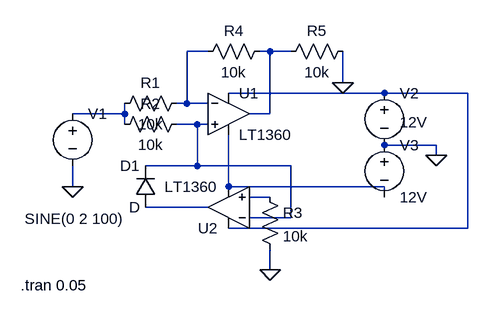
[diagram p0: schematic Functia modul.asc]
Functia modul.asc, the LTspice schematic file:
Version 4
SHEET 1 880 680
WIRE 192 16 160 16
WIRE 288 16 272 16
WIRE 320 16 288 16
WIRE 400 64 400 16
WIRE 464 80 224 80
WIRE 592 80 464 80
WIRE 160 96 160 16
WIRE 160 96 144 96
WIRE 192 96 160 96
WIRE 64 112 64 96
WIRE 64 112 -16 112
WIRE 288 112 288 16
WIRE 288 112 256 112
WIRE 64 128 64 112
WIRE 176 128 144 128
WIRE 192 128 176 128
WIRE 544 160 464 160
WIRE 544 176 544 160
WIRE 176 192 176 128
WIRE 176 192 96 192
WIRE 320 192 176 192
WIRE -16 224 -16 192
WIRE 224 224 224 144
WIRE 464 224 224 224
WIRE 288 240 256 240
WIRE 464 240 464 224
WIRE 192 256 96 256
WIRE 320 272 320 192
WIRE 320 272 256 272
WIRE 592 288 592 80
WIRE 592 288 224 288
WIRE 288 352 288 320
FLAG -16 224 0
FLAG 288 352 0
FLAG 400 64 0
FLAG 544 176 0
SYMBOL diode 112 256 R180
WINDOW 0 24 64 Left 2
WINDOW 3 24 0 Left 2
SYMATTR InstName D1
SYMBOL res 160 80 R90
WINDOW 0 0 56 VBottom 2
WINDOW 3 32 56 VTop 2
SYMATTR InstName R1
SYMATTR Value 10k
SYMBOL res 160 112 R90
WINDOW 0 0 56 VBottom 2
WINDOW 3 32 56 VTop 2
SYMATTR InstName R2
SYMATTR Value 10k
SYMBOL voltage -16 96 R0
WINDOW 3 -74 177 Left 2
WINDOW 123 0 0 Left 2
WINDOW 39 0 0 Left 2
SYMATTR Value SINE(0 2 100)
SYMATTR InstName V1
SYMBOL res 272 224 R0
SYMATTR InstName R3
SYMATTR Value 10k
SYMBOL res 288 0 R90
WINDOW 0 0 56 VBottom 2
WINDOW 3 32 56 VTop 2
SYMATTR InstName R4
SYMATTR Value 10k
SYMBOL res 416 0 R90
WINDOW 0 0 56 VBottom 2
WINDOW 3 32 56 VTop 2
SYMATTR InstName R5
SYMATTR Value 10k
SYMBOL voltage 464 64 R0
WINDOW 3 24 61 Left 2
WINDOW 123 0 0 Left 2
WINDOW 39 0 0 Left 2
SYMATTR Value 12V
SYMATTR InstName V2
SYMBOL voltage 464 144 R0
WINDOW 123 0 0 Left 2
WINDOW 39 0 0 Left 2
SYMATTR InstName V3
SYMATTR Value 12V
SYMBOL Opamps\\LT1360 224 48 R0
SYMATTR InstName U1
SYMBOL Opamps\\LT1360 224 320 R180
SYMATTR InstName U2
TEXT -96 376 Left 2 !.tran 0.05

The netlist it stands for:
* Functia modul.asc
D1 N008 N005 D
R1 N001 N004 10k
R2 N005 N004 10k
V1 N004 0 SINE(0 2 100)
R3 N007 0 10k
R4 N002 N001 10k
R5 0 N002 10k
V2 N003 0 12V
V3 0 N006 12V
XU1 N005 N001 N003 N006 N002 LT1360  ; pins In+ In- V+ V- OUT
XU2 N007 N005 N003 N006 N008 LT1360  ; pins In+ In- V+ V- OUT
.model D D
.lib standard.dio
.tran 0.05
.backanno
.end